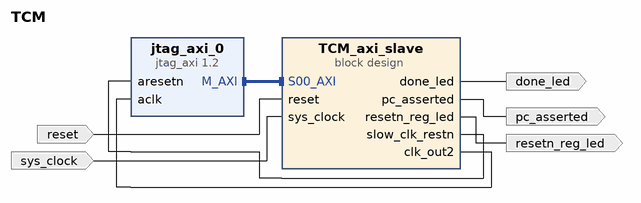
[diagram p0: block diagram of the top level]
# Vivado block design TCM, xc7a100tcsg324-1, Vivado 2026.1
create_bd_design TCM

create_bd_port -dir I -type rst reset
set_property -dict {CONFIG.POLARITY ACTIVE_HIGH} [get_bd_ports reset]
create_bd_port -dir I -type clk sys_clock
set_property -dict {CONFIG.FREQ_HZ 100000000 CONFIG.PHASE 0.0} [get_bd_ports sys_clock]
create_bd_port -dir O pc_asserted
create_bd_port -dir O resetn_reg_led
create_bd_port -dir O done_led

create_bd_cell -type ip -vlnv xilinx.com:ip:jtag_axi:1.2 jtag_axi_0
set_property -dict {CONFIG.PROTOCOL 0} [get_bd_cells jtag_axi_0]
create_bd_cell -type container -reference TCM_axi_slave TCM_axi_slave
set_property -dict [list \
  CONFIG.ACTIVE_SIM_BD TCM_axi_slave.bd \
  CONFIG.ACTIVE_SYNTH_BD TCM_axi_slave.bd \
  CONFIG.ENABLE_DFX 0 \
  CONFIG.LIST_SIM_BD TCM_axi_slave.bd \
  CONFIG.LIST_SYNTH_BD TCM_axi_slave.bd \
  CONFIG.LOCK_PROPAGATE 0 \
] [get_bd_cells TCM_axi_slave]

# ---- connections ----

connect_bd_intf_net [get_bd_intf_pins jtag_axi_0/M_AXI] [get_bd_intf_pins TCM_axi_slave/S00_AXI]
connect_bd_net [get_bd_pins TCM_axi_slave/done_led] [get_bd_ports done_led]
connect_bd_net [get_bd_pins TCM_axi_slave/pc_asserted] [get_bd_ports pc_asserted]
connect_bd_net [get_bd_pins TCM_axi_slave/resetn_reg_led] [get_bd_ports resetn_reg_led]
connect_bd_net [get_bd_pins TCM_axi_slave/slow_clk_restn] [get_bd_pins jtag_axi_0/aresetn]
connect_bd_net -net clk_wiz_1_clk_out1 [get_bd_pins TCM_axi_slave/clk_out2] [get_bd_pins jtag_axi_0/aclk]
connect_bd_net -net resetn_1 [get_bd_ports reset] [get_bd_pins TCM_axi_slave/reset]
connect_bd_net [get_bd_ports sys_clock] [get_bd_pins TCM_axi_slave/sys_clock]

# ---- address map ----
assign_bd_address -offset 0x00000000 -range 64K -target_address_space [get_bd_addr_spaces jtag_axi_0/Data] [get_bd_addr_segs TCM_axi_slave/axi_bram_ctrl_0/S_AXI/Mem0]
assign_bd_address -offset 0x80000000 -range 64K -target_address_space [get_bd_addr_spaces jtag_axi_0/Data] [get_bd_addr_segs TCM_axi_slave/axi_bram_ctrl_1/S_AXI/Mem0]
assign_bd_address -offset 0xC0000000 -range 128 -target_address_space [get_bd_addr_spaces jtag_axi_0/Data] [get_bd_addr_segs TCM_axi_slave/test_controller_1/S_AXI/reg0]

validate_bd_design
save_bd_design
